# Altium schematic sheet Brushless Motor (Drone Motor).SchDoc
size A4; SheetNumber: 3; SheetTotal: 3
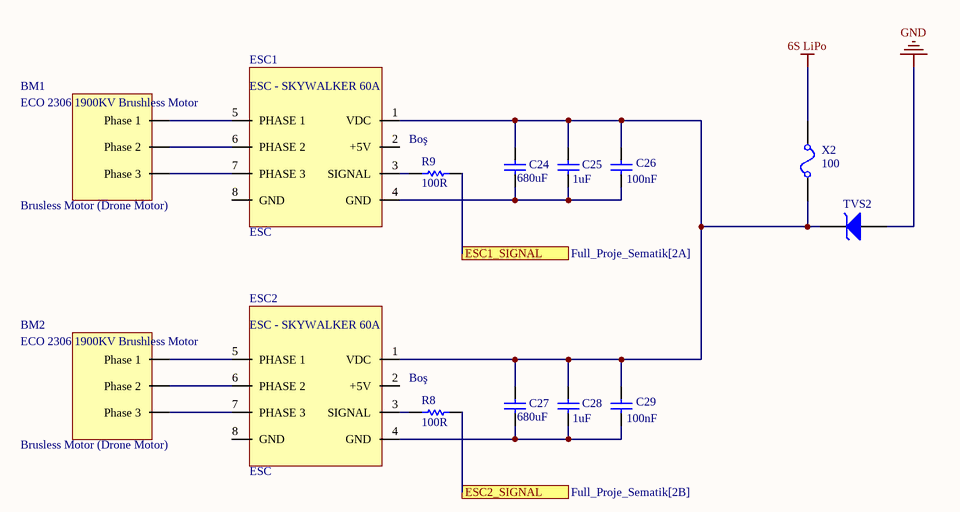
[diagram p0: Brushless Motor (Drone Motor).SchDoc]

## Parts
BM1  Brusless Motor (Drone Motor)
BM2  Brusless Motor (Drone Motor)
C24  value 680uF  (hidden comment: Capacitor)
C25  value 1uF  (hidden comment: Capacitor)
C26  value 100nF  (hidden comment: Capacitor)
C27  value 680uF  (hidden comment: Capacitor)
C28  value 1uF  (hidden comment: Capacitor)
C29  value 100nF  (hidden comment: Capacitor)
ESC1  ESC
ESC2  ESC
R8  value 100R  (hidden comment: Resistor)
R9  value 100R  (hidden comment: Resistor)
TVS2  Suppressor Single  (value not drawn)
X2  CURRENT: 100  (hidden comment: Fuse)

## Ports
ESC1_SIGNAL (see Full_Proje_Sematik[2A]), ESC2_SIGNAL (see Full_Proje_Sematik[2B])

## Nets
6S LiPo: X2.2
GND: TVS2.1(A)
ESC1_SIGNAL: R9.2 ; port ESC1_SIGNAL
ESC2_SIGNAL: R8.2 ; port ESC2_SIGNAL
NetBM1_0: BM1.0(Phase_1) ESC1.5(PHASE_1)
NetBM1_1: BM1.1(Phase_2) ESC1.6(PHASE_2)
NetBM1_2: BM1.2(Phase_3) ESC1.7(PHASE_3)
NetBM2_0: BM2.0(Phase_1) ESC2.5(PHASE_1)
NetBM2_1: BM2.1(Phase_2) ESC2.6(PHASE_2)
NetBM2_2: BM2.2(Phase_3) ESC2.7(PHASE_3)
NetC24_1: C24.1 C25.1 C26.1 C27.1 C28.1 C29.1 ESC1.1(VDC) ESC2.1(VDC) TVS2.2(K) X2.1
NetC24_2: C24.2 C25.2 C26.2 ESC1.4(GND)
NetC27_2: C27.2 C28.2 C29.2 ESC2.4(GND)
NetESC1_3: ESC1.3(SIGNAL) R9.1
NetESC2_3: ESC2.3(SIGNAL) R8.1

Not connected (* = marked no-connect by the designer): ESC1 2(+5V) 8(GND); ESC2 2(+5V) 8(GND)

## Notes on the sheet
- Boş
- (in symbol ESC) ESC - SKYWALKER 60A

## Library data of the parts
BM1 BM2 = Brusless Motor (Drone Motor): ECO 2306 1900KV Brushless Motor
C24 C27 = Capacitor: Bulk Capacitor 50V LOW ESR; SimulationGenericComponent: True
C25 C26 C28 C29 = Capacitor: Seramic Capacitor 50V X7R; SimulationGenericComponent: True
ESC1 ESC2 = ESC: SkyWalker 60A
R8 R9 = Resistor: TC1: 0; SimulationGenericComponent: True; TC2: 0
TVS2 = Suppressor Single: 33V (VRWM) / 1500W / Unidirectional / SMBJ33A; AF: 1; BV: 0; BV_MAX: 1e99; EG: 1.11; FC: 0.5; IBV: 0.001; IS: 1e-14; MJSW: 0.33; NTUN: 30; TNOM: 27; XTI: 3; SimulationGenericComponent: True; CJO: 0; CJP: 0; CTA: 0; CTP: 0; FCS: 0.5; FV_MAX: 1e99; IKF: 0; IKR: 0; ISR: 1e-14; JSW: 0; JTUN: 0; JTUNSW: 0; KEG: 1; KF: 0; LEVEL: 1; N: 1; NBV: 1; NR: 1; NS: 1; PHP: 1; RS: 0; TCV: 0; TLEV: 0; TLEVC: 0; TM1: 0; TM2: 0; TPB: 0; TPHP: 0; TRS: 0; TRS2: 0; TT: 0; TTT1: 0; TTT2: 0; VJ: 1; XTITUN: 3
X2 = Fuse: 100A Slow Blow Fuse; RESISTANCE: 1m; SimulationGenericComponent: True